# EasyEDA Pro project fc_epro.epro

# Schematic FC
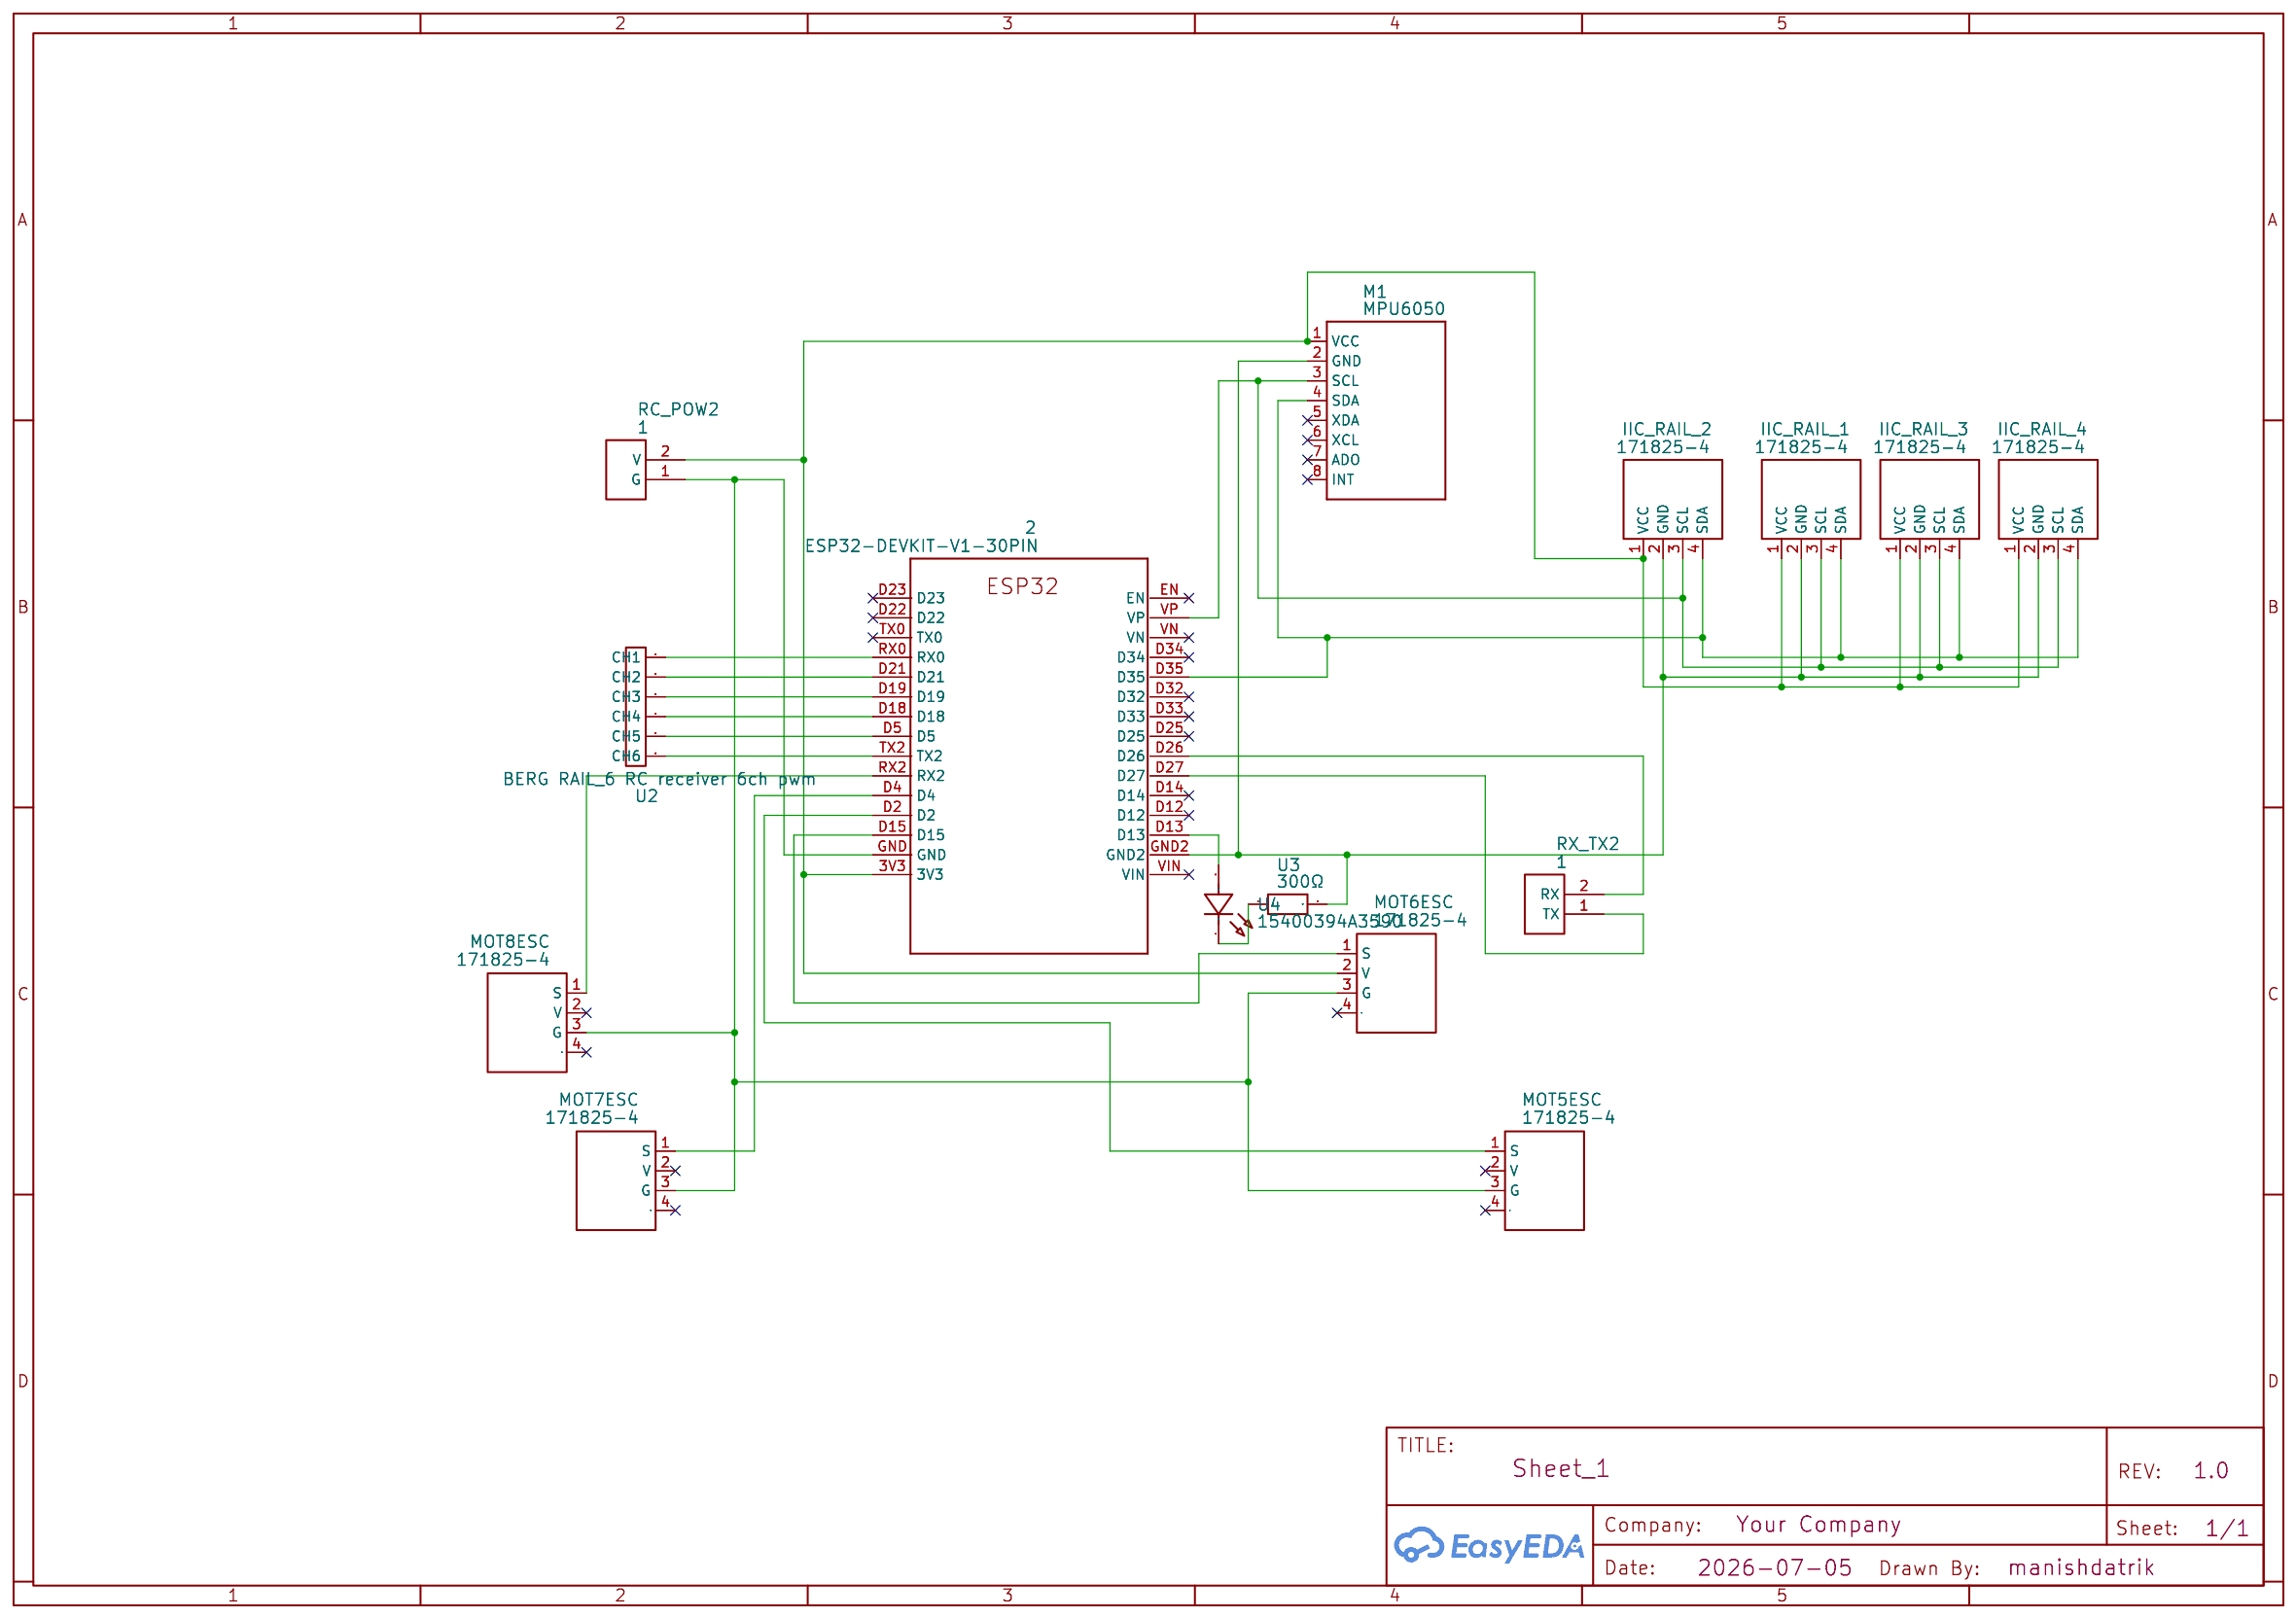
[diagram p0: schematic sheet]

## Parts
2  ESP32-DEVKIT-V1-30PIN  [ESP32-DEVKITV1_ESP32-DEVKITV1]
IIC_RAIL_1  171825-4  [HDR-TH_4P-P2.54-D1.0]
IIC_RAIL_2  171825-4  [HDR-TH_4P-P2.54-D1.0]
IIC_RAIL_3  171825-4  [HDR-TH_4P-P2.54-D1.0]
IIC_RAIL_4  171825-4  [HDR-TH_4P-P2.54-D1.0]
M1  MPU6050  [MPU6050]
MOT5ESC  171825-4  [HDR-TH_4P-P2.54-D1.0]
MOT6ESC  171825-4  [HDR-TH_4P-P2.54-D1.0]
MOT7ESC  171825-4  [HDR-TH_4P-P2.54-D1.0]
MOT8ESC  171825-4  [HDR-TH_4P-P2.54-D1.0]
RC_POW2  1  [BERG2]
RX_TX2  1  [BERG2]
U2  BERG RAIL_6 RC receiver 6ch pwm  [BERG_6]
U3  300Ω  [RES-TH_BD3.8-L10.3-P14.30-D0.7]
U4  15400394A3590  [LED-TH_BD3.0-P2.54-RD-RED]

## Library data of the parts
2 = ESP32-DEVKIT-V1-30PIN
IIC_RAIL_1-IIC_RAIL_4 MOT5ESC MOT6ESC MOT7ESC MOT8ESC = 171825-4: Supplier: LCSC; Supplier Part: C210162; Manufacturer: TE Connectivity(泰科电子); JLCPCB Part Class: Extended Part
M1 = MPU6050
RC_POW2 = Berg2
RX_TX2 = 1: Manufacturer Part: Berg2
U2 = BERG RAIL_6 RC receiver 6ch pwm
U3 = 300Ω: Supplier: LCSC; Supplier Part: C3395810; Manufacturer: Ohmite; Manufacturer Part: OF301JE; JLCPCB Part Class: Extended Part
U4 = 15400394A3590: Supplier: LCSC; Supplier Part: C5478689; Manufacturer: Wurth(伍尔特)

## Nets
2_D13: 2.D13 U4.2(A)
IIC_RAIL_2_1: 2.3V3 IIC_RAIL_1.1(VCC) IIC_RAIL_2.1(VCC) IIC_RAIL_3.1(VCC) IIC_RAIL_4.1(VCC) M1.1(VCC) MOT6ESC.2(V) RC_POW2.2(V)
IIC_RAIL_2_2: 2.GND2 IIC_RAIL_1.2(GND) IIC_RAIL_2.2(GND) IIC_RAIL_3.2(GND) IIC_RAIL_4.2(GND) M1.2(GND) U3.2
IIC_RAIL_2_3: 2.VP IIC_RAIL_1.3(SCL) IIC_RAIL_2.3(SCL) IIC_RAIL_3.3(SCL) IIC_RAIL_4.3(SCL) M1.3(SCL)
IIC_RAIL_2_4: 2.D35 IIC_RAIL_1.4(SDA) IIC_RAIL_2.4(SDA) IIC_RAIL_3.4(SDA) IIC_RAIL_4.4(SDA) M1.4(SDA)
MOT5ESC_1: 2.D2 MOT5ESC.1(S)
MOT5ESC_3: 2.GND MOT5ESC.3(G) MOT6ESC.3(G) MOT7ESC.3(G) MOT8ESC.3(G) RC_POW2.1(G)
MOT6ESC_1: 2.D15 MOT6ESC.1(S)
MOT7ESC_1: 2.D4 MOT7ESC.1(S)
MOT8ESC_1: 2.RX2 MOT8ESC.1(S)
RX_TX2_1: 2.D27 RX_TX2.1(TX)
RX_TX2_2: 2.D26 RX_TX2.2(RX)
U2_1: 2.RX0 U2.1(CH1)
U2_2: 2.D21 U2.2(CH2)
U2_3: 2.D19 U2.3(CH3)
U2_4: 2.D18 U2.4(CH4)
U2_5: 2.D5 U2.5(CH5)
U2_6: 2.TX2 U2.6(CH6)
U3_1: U3.1 U4.1(K)

Not connected (* = marked no-connect by the designer): 2 D12* D14* D22* D23* D25* D32* D33* D34* EN* TX0* VIN* VN*; M1 5(XDA)* 6(XCL)* 7(ADO)* 8(INT)*; MOT5ESC 2(V)* 4*; MOT6ESC 4*; MOT7ESC 2(V)* 4*; MOT8ESC 2(V)* 4*

# Board 1-PCB_PCB_FC
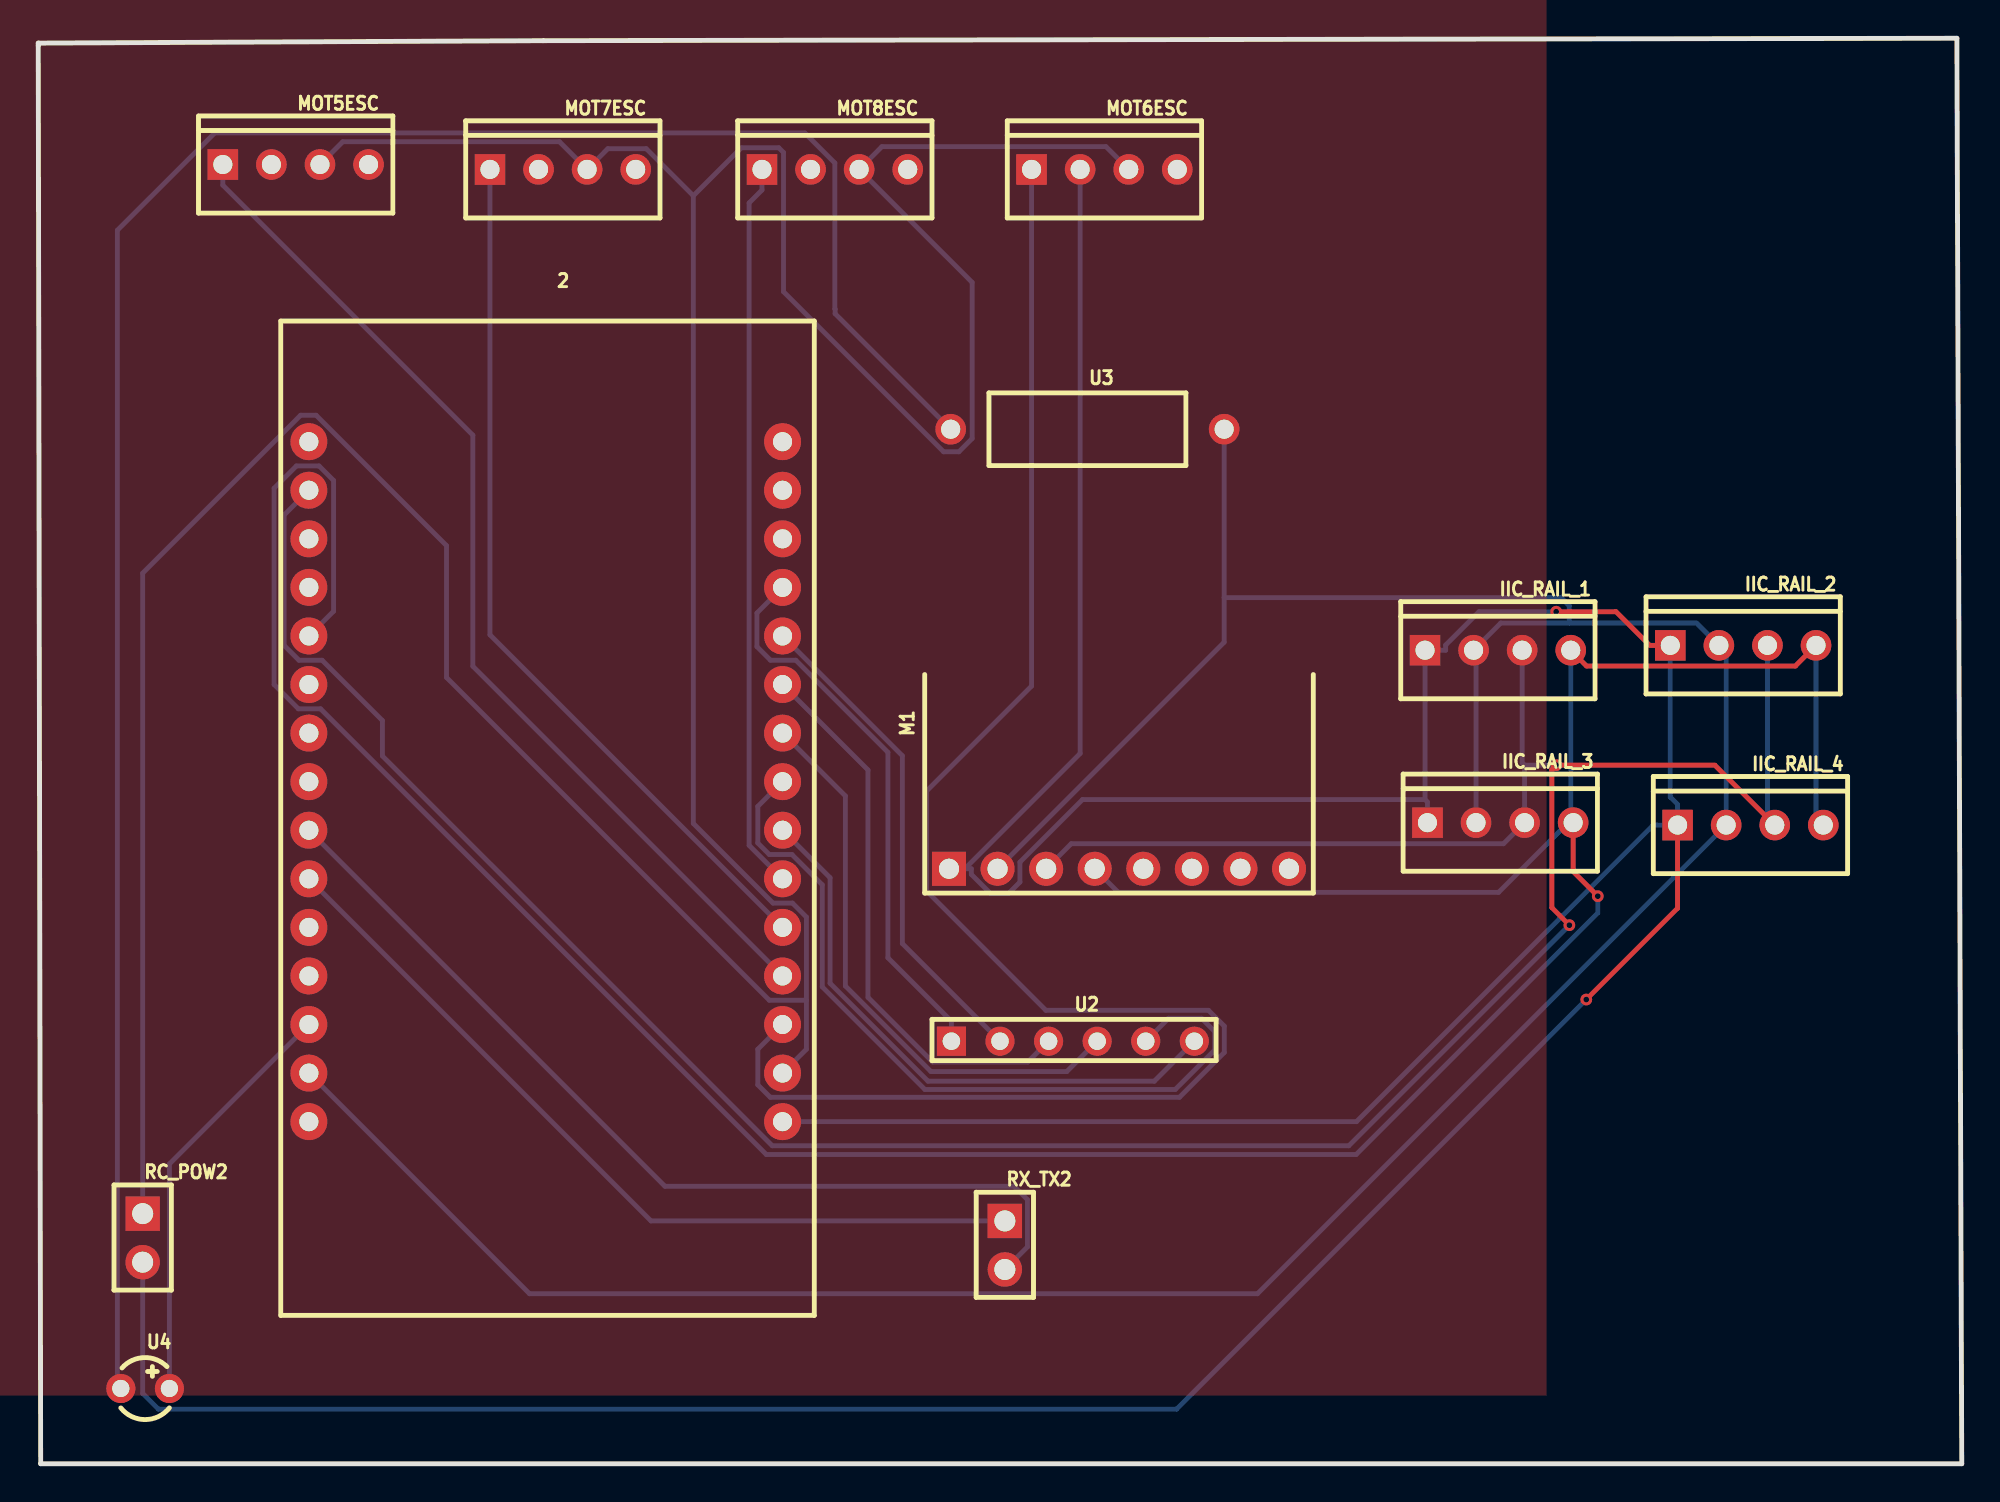
[diagram p1: board, top side]
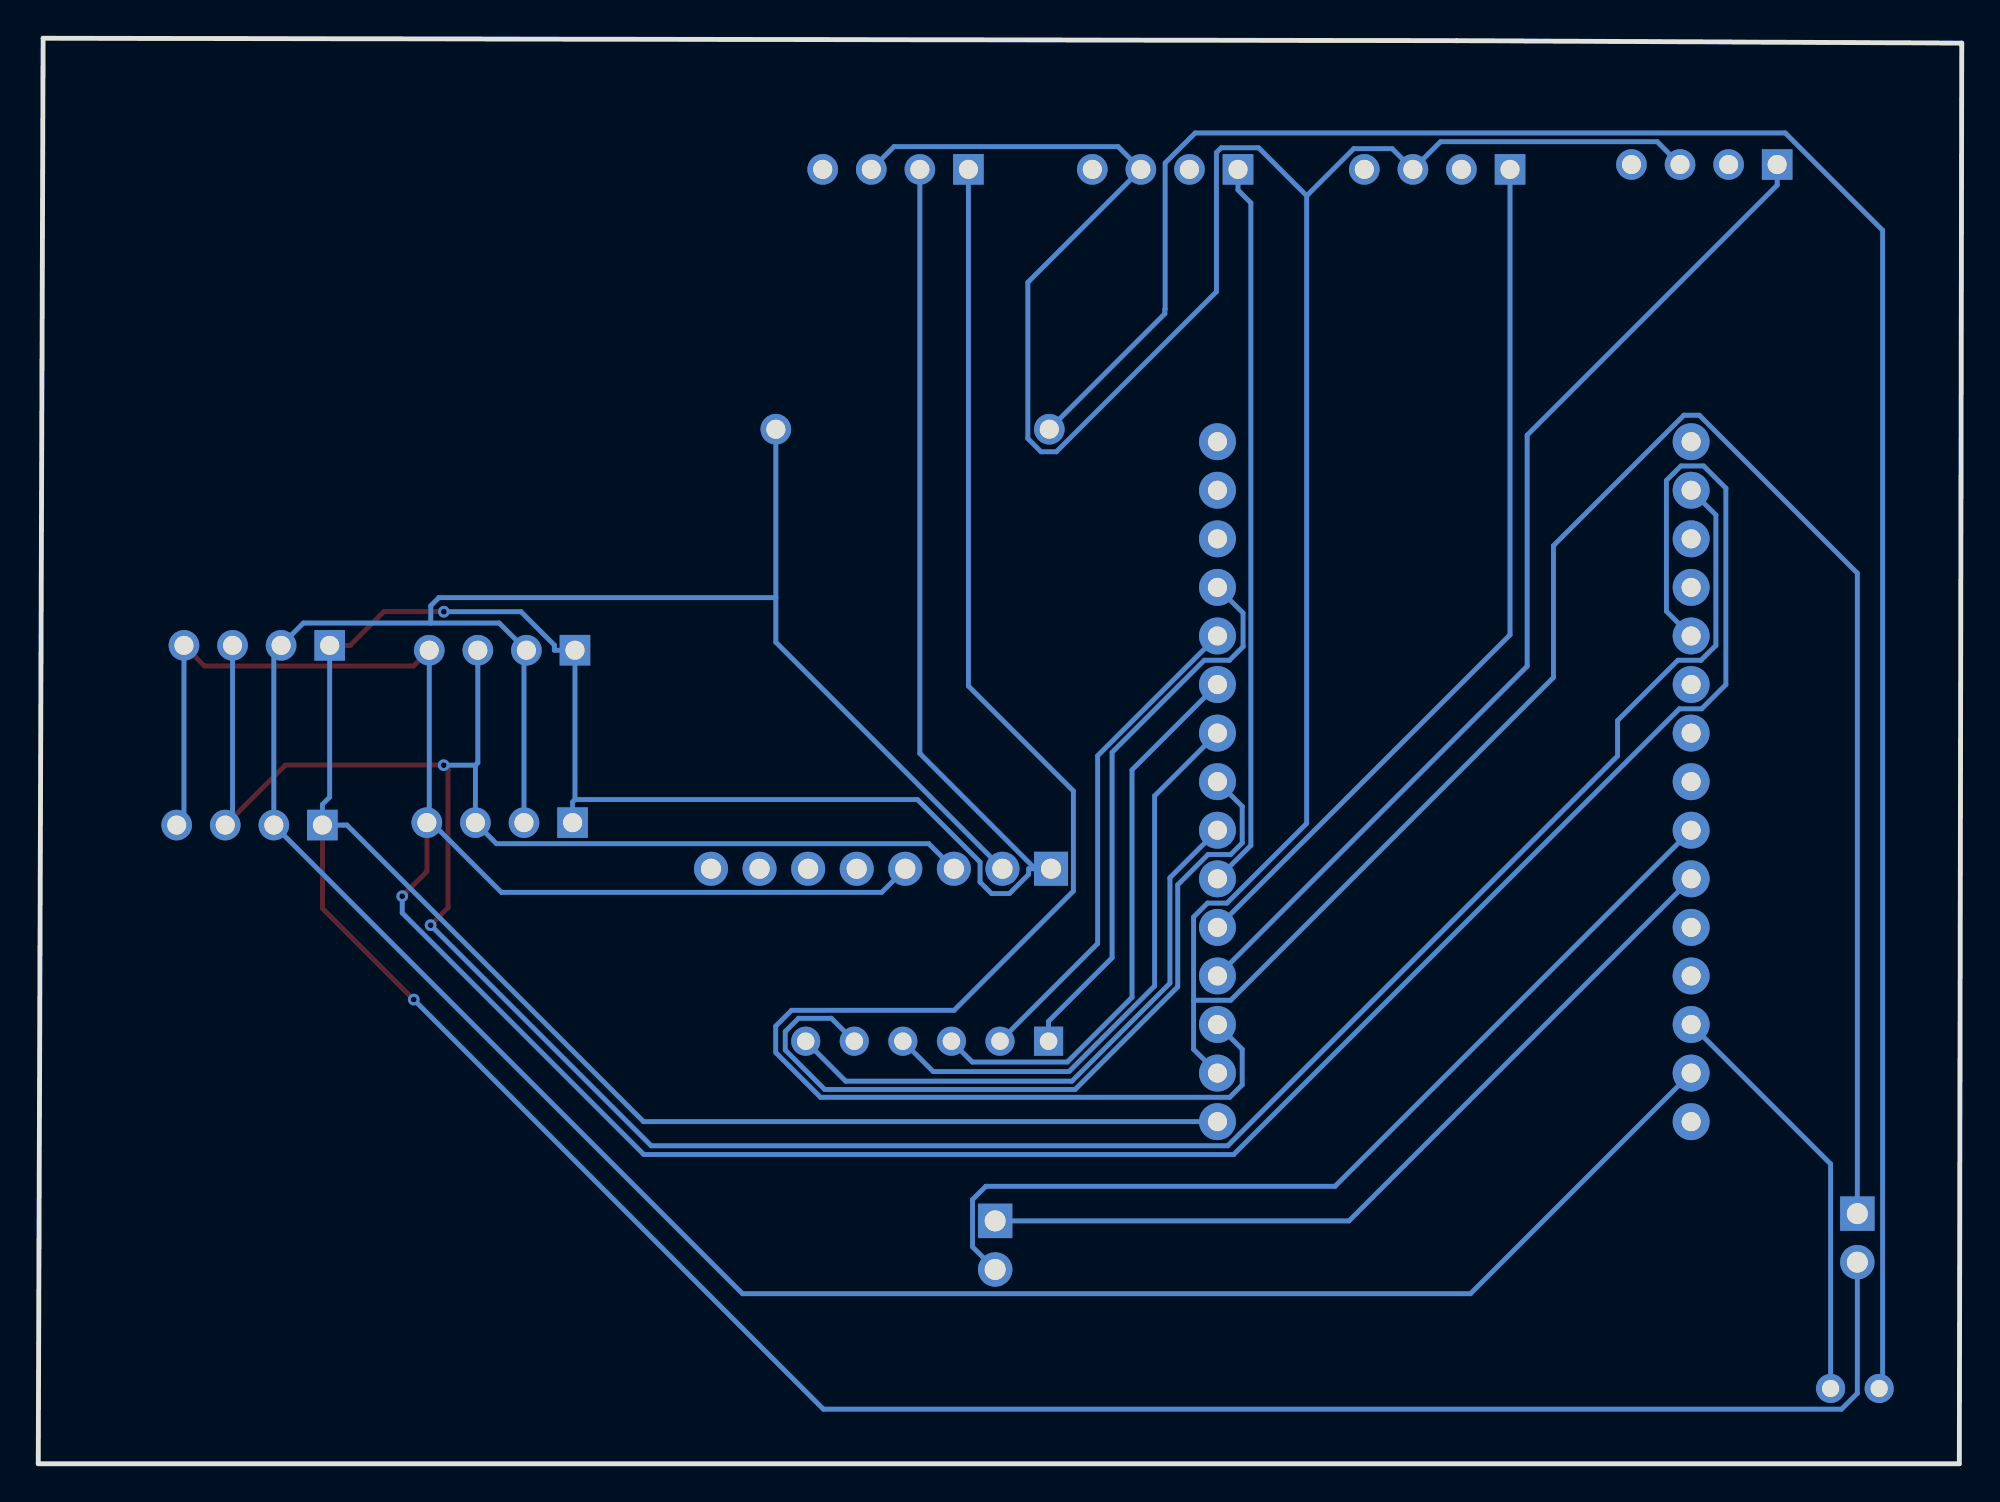
[diagram p2: board, bottom side, seen from below]

Outline 100.58 x 74.55 mm; copper layers: Top Layer, Bottom Layer. Coordinates in mm from the lower left corner of the outline.
Outline path: 0,74.3 26.42,74.42 100.33,74.55 100.58,0 0.13,0 0,74.17 0,74.3
Stack: Top Layer 0.035mm / Bottom Layer 0.035mm

## Design rules (mm)
spacing Default (default): track to track 0.102, other pairs 0 to 0.3
track width Default (default): min 0.254, default 0.254, max 25.4
differential pair differentialPair (default): width min 0.127, default 2.54, max 2.54; gap min 0.127, default 0.152

## Placement (name value [footprint] x y rotation side)
2  ESP32-DEVKIT-V1-30PIN  [ESP32-DEVKITV1_ESP32-DEVKITV1]  33.66 36.32 0 top
IIC_RAIL_1  171825-4  [HDR-TH_4P-P2.54-D1.0]  76.33 42.55 0 top
IIC_RAIL_2  171825-4  [HDR-TH_4P-P2.54-D1.0]  89.15 42.8 0 top
IIC_RAIL_3  171825-4  [HDR-TH_4P-P2.54-D1.0]  76.45 33.53 0 top
IIC_RAIL_4  171825-4  [HDR-TH_4P-P2.54-D1.0]  89.53 33.4 0 top
M1  -  [MPU6050]  56.51 31.12 90 top
MOT5ESC  171825-4  [HDR-TH_4P-P2.54-D1.0]  13.46 67.95 0 top
MOT6ESC  171825-4  [HDR-TH_4P-P2.54-D1.0]  55.75 67.69 0 top
MOT7ESC  171825-4  [HDR-TH_4P-P2.54-D1.0]  27.43 67.69 0 top
MOT8ESC  171825-4  [HDR-TH_4P-P2.54-D1.0]  41.66 67.69 0 top
RC_POW2  1  [BERG2]  5.46 13.08 0 top
RX_TX2  1  [BERG2]  50.55 12.7 0 top
U2  BERG RAIL_6 RC receiver 6ch pwm  [BERG_6]  47.75 22.1 0 top
U3  300Ω  [RES-TH_BD3.8-L10.3-P14.30-D0.7]  54.86 54.1 0 top
U4  15400394A3590  [LED-TH_BD3.0-P2.54-RD-RED]  5.59 3.94 0 top

## Footprints (pads in the part's own frame, mm; a bottom-side part is the same pattern mirrored in y, then rotated)
BERG2
  rect 1.8x1.8 hole 1.1: 1(0,0)
  round 1.8 hole 1.1: 2(0,-2.54)
BERG_6
  rect 1.524x1.524 hole 0.914: 1(0,0)
  round 1.524 hole 0.914: 2(2.54,0) 3(5.08,0) 4(7.62,0) 5(10.16,0) 6(12.7,0)
ESP32-DEVKITV1_ESP32-DEVKITV1
  round 1.931 hole 1x1: 3V3(5.266,-18.431) D2(5.266,-10.812) D4(5.266,-8.271) D5(5.266,-0.651) D12(-19.504,-10.812) D13(-19.504,-13.351) D14(-19.504,-8.271) D15(5.266,-13.351) D18(5.266,1.889) D19(5.266,4.428) D21(5.266,6.968) D22(5.266,14.588) D23(5.266,17.128) D25(-19.504,-0.651) D26(-19.504,-3.192) D27(-19.504,-5.731) D32(-19.504,4.428) D33(-19.504,1.889) D34(-19.504,9.508) D35(-19.504,6.968) EN(-19.504,17.128) GND(5.266,-15.892) GND2(-19.504,-15.892) RX0(5.266,9.508) RX2(5.266,-5.731) TX0(5.266,12.049) TX2(5.266,-3.192) VIN(-19.504,-18.431) VN(-19.504,12.049) VP(-19.504,14.588)
HDR-TH_4P-P2.54-D1.0
  rect 1.6x1.6 hole 1: 1(-3.81,0)
  round 1.6 hole 1: 2(-1.27,0) 3(1.27,0) 4(3.81,0)
LED-TH_BD3.0-P2.54-RD-RED
  round 1.524 hole 0.9: 1(-1.27,0) 2(1.27,0)
MPU6050
  rect 1.778x1.778 hole 1.05x1.055: 1(0,8.89)
  round 1.778 hole 1.05x1.055: 2(0,6.35) 3(0,3.81) 4(0,1.27) 5(0,-1.27) 6(0,-3.81) 7(0,-6.35) 8(0,-8.89)
RES-TH_BD3.8-L10.3-P14.30-D0.7
  round 1.6 hole 1: 1(-7.15,0) 2(7.15,0)

## Nets
As in the schematic.

Pads without a net: 2 D12 D14 D22 D23 D25 D32 D33 D34 EN TX0 VIN VN; M1 5 6 7 8; MOT5ESC 2 4; MOT6ESC 4; MOT7ESC 2 4; MOT8ESC 2 4

## Via types
v1: diameter 0.61, hole 0.305, Top Layer to Bottom Layer, 5 vias

## Routing (per net, layer and track width the routed paths; a pad name or vN(x,y) marks a point on that pad's centre or on a via; arc(x,y) is an arc through that point)
2_D13: length 22.1
  Bottom Layer w0.254: U4.2 6.86,15.68 2.D13
IIC_RAIL_2_1: length 256.4
  Top Layer w0.254: v1(80.95,24.28) 85.72,29.05 IIC_RAIL_4.1 ; IIC_RAIL_2.1 84.26,42.8 82.51,44.56 v1(79.38,44.56)
  Bottom Layer w0.254: 48.45,31.12 54.48,37.15 54.48,67.69 ; 48.45,31.12 48.79,31.12 48.79,30.82 49.8,29.82 50.74,29.82 51.34,30.42 51.34,31.46 54.61,34.73 72.52,34.73 ; 48.45,31.12 M1.1 ; 72.52,34.73 72.64,34.61 IIC_RAIL_3.1 ; 72.52,34.73 IIC_RAIL_1.1 73.6,42.55 73.6,42.82 75.34,44.56 v1(79.38,44.56) ; IIC_RAIL_2.1 85.34,34.86 85.72,34.48 IIC_RAIL_4.1 84.44,33.4 68.93,17.89 2.3V3 ; v1(80.95,24.28) 59.53,2.86 6.29,2.86 5.46,3.68 RC_POW2.2
IIC_RAIL_2_2: length 168.6
  Bottom Layer w0.254: U3.2 62.01,45.3 ; 62.01,45.3 79.63,45.3 80.06,44.87 80.06,43.97 ; 62.01,45.3 62.01,42.96 M1.2 ; IIC_RAIL_3.2 75.18,42.42 IIC_RAIL_1.2 76.48,43.97 80.06,43.97 ; 80.06,43.97 86.72,43.97 IIC_RAIL_2.2 88.26,42.42 IIC_RAIL_4.2 63.76,8.89 25.69,8.89 2.GND2
IIC_RAIL_2_3: length 160.4
  Top Layer w0.254: IIC_RAIL_4.3 87.67,36.53 v1(79.38,36.53) 79.15,36.3 79.15,29.08 v1(80.07,28.17)
  Bottom Layer w0.254: IIC_RAIL_2.3 90.42,33.78 IIC_RAIL_4.3 ; M1.3 54.01,32.43 76.62,32.43 IIC_RAIL_3.3 77.72,36.53 ; 77.72,36.53 77.6,36.66 IIC_RAIL_1.3 ; 77.72,36.53 v1(79.38,36.53) ; v1(80.07,28.17) 68.53,16.63 38.38,16.63 18,37.02 18,38.87 14.84,42.02 13.63,42.02 12.86,42.8 12.86,49.62 2.VP
IIC_RAIL_2_4: length 171.9
  Top Layer w0.254: v1(81.55,29.68) 80.26,30.97 IIC_RAIL_3.4 ; IIC_RAIL_2.4 91.88,41.72 80.96,41.72 IIC_RAIL_1.4
  Bottom Layer w0.254: 80.14,33.66 76.36,29.88 56.48,29.88 M1.4 ; 80.14,33.66 IIC_RAIL_1.4 ; 80.14,33.66 IIC_RAIL_3.4 ; 2.D35 15.44,44.59 15.44,51.42 14.69,52.18 13.5,52.18 12.33,51.02 12.33,40.75 13.6,39.48 14.76,39.48 38.07,16.17 68.91,16.17 81.55,28.81 v1(81.55,29.68) ; IIC_RAIL_2.4 92.96,33.78 IIC_RAIL_4.4
MOT5ESC_1: length 54.6
  Bottom Layer w0.254: 2.D2 22.73,41.71 22.73,53.79 9.65,66.87 MOT5ESC.1
MOT5ESC_3: length 218.2
  Bottom Layer w0.254: 34.25,66.31 34.25,33.49 38.42,29.32 39.44,29.32 40.17,28.59 40.17,24.24 ; 34.25,66.31 31.79,68.77 29.78,68.77 MOT7ESC.3 27.25,69.14 15.93,69.14 MOT5ESC.3 ; 34.25,66.31 36.77,68.82 38.72,68.82 38.97,68.57 38.97,61.29 47.34,52.92 48.14,52.92 48.84,53.62 48.84,61.78 MOT8ESC.3 44.11,68.88 55.83,68.88 MOT6ESC.3 ; 40.17,24.24 38.23,24.24 21.35,41.12 21.35,48.01 14.53,54.83 13.72,54.83 5.46,46.58 RC_POW2.1 ; 40.17,24.24 40.17,21.68 2.GND
MOT6ESC_1: length 89.2
  Bottom Layer w0.254: MOT6ESC.1 51.94,40.67 46.45,35.18 46.45,29.95 52.69,23.71 61.19,23.71 62.02,22.89 62.02,21.51 59.68,19.16 38.28,19.16 37.63,19.82 37.63,21.68 2.D15
MOT7ESC_1: length 46
  Bottom Layer w0.254: MOT7ESC.1 23.62,43.35 2.D4
MOT8ESC_1: length 38.1
  Bottom Layer w0.254: 2.RX2 37.17,32.34 37.17,65.94 37.85,66.61 MOT8ESC.1
RX_TX2_1: length 43.8
  Bottom Layer w0.254: RX_TX2.1 32.04,12.7 2.D27
RX_TX2_2: length 49.7
  Bottom Layer w0.254: 2.D26 32.77,14.51 51.03,14.51 51.73,13.81 51.73,11.34 RX_TX2.2
U2_1: length 29.3
  Bottom Layer w0.254: U2.1 47.75,23.14 44.43,26.46 44.43,37.2 39.61,42.02 38.29,42.02 37.58,42.73 37.58,44.49 2.RX0
U2_2: length 25.9
  Bottom Layer w0.254: 2.D21 45.19,37.03 45.19,27.2 U2.2
U2_3: length 29.5
  Bottom Layer w0.254: U2.3 51.74,21.01 46.77,21.01 43.39,24.39 43.39,36.28 2.D19
U2_4: length 30.3
  Bottom Layer w0.254: 2.D18 42.21,34.93 42.21,24.99 46.68,20.51 53.79,20.51 U2.4
U2_5: length 42.3
  Bottom Layer w0.254: 2.D5 37.63,34.38 37.63,32.46 38.23,31.86 39.41,31.86 41,30.28 41,24.94 46.37,19.57 59.45,19.57 61.52,21.64 61.52,22.6 60.83,23.3 59.11,23.3 U2.5
U2_6: length 31.1
  Bottom Layer w0.254: U2.6 58.36,20.01 46.53,20.01 41.41,25.13 41.41,30.65 2.TX2
U3_1: length 117.4
  Bottom Layer w0.254: U4.1 4.14,4.12 4.14,64.51 9.23,69.6 40.09,69.6 41.66,68.02 41.66,60.39 41.67,60.38 41.67,60.15 U3.1

## Copper pours and planes (outline as drawn; the poured copper is in the pictures)
(no net) on Top Layer: -24.77,106.93 78.87,106.93 78.87,3.56 -24.77,3.56
